# Altium schematic sheet IO.SchDoc
size B; SheetNumber: 4; SheetTotal: 4
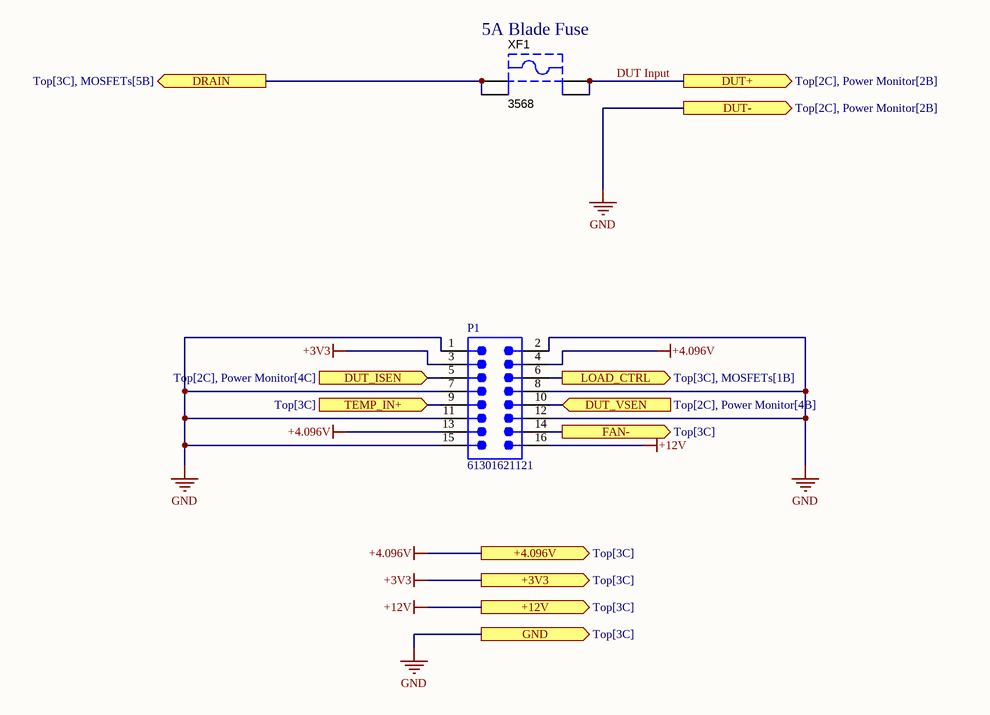
[diagram p0: IO.SchDoc]

## Parts
P1  61301621121  [61301621121]
XF1  3568  [KSTN-3568_V]

## Ports
+3V3 (out, see Top[3C]), +4.096V (out, see Top[3C]), +12V (out, see Top[3C]), DRAIN (out, see Top[3C], MOSFETs[5B]), DUT+ (out, see Top[2C], Power Monitor[2B]), DUT- (out, see Top[2C], Power Monitor[2B]), DUT_ISEN (in, see Top[2C], Power Monitor[4C]), DUT_VSEN (in, see Top[2C], Power Monitor[4B]), FAN- (out, see Top[3C]), GND (out, see Top[3C]), LOAD_CTRL (out, see Top[3C], MOSFETs[1B]), TEMP_IN+ (in, see Top[3C])

## Nets
+3V3: P1.3 ; port +3V3
+4.096V: P1.4 P1.13 ; port +4.096V
+12V: P1.16 ; port +12V
GND: P1.1 P1.2 P1.7 P1.8 P1.11 P1.12 P1.15 ; port DUT-, port GND
DRAIN: XF1.1 XF1.2 ; port DRAIN
DUT Input: XF1.3 XF1.4 ; port DUT+
DUT_ISEN: P1.5 ; port DUT_ISEN
DUT_VSEN: P1.10 ; port DUT_VSEN
FAN-: P1.14 ; port FAN-
LOAD_CTRL: P1.6 ; port LOAD_CTRL
TEMP_IN+: P1.9 ; port TEMP_IN+

## Notes on the sheet
- (near XF1) 5A Blade Fuse

## Library data of the parts
P1 = CMP-1502-01097-3: NexarPartId: 32855550; Contact Resistance: 20mΩ; Operating Supply Voltage: 250V; Number of Contacts: 16; Current Rating: 3A; Connector Type: Male Pin; Row Spacing: 2.54mm; Gender: Male; Min Operating Temperature: -40°C; Contact Material: Copper; RoHS: Compliant; Lead Pitch: 2.54mm; Color: Black; Contact Mating Length: 5.9944mm; REACH SVHC: Unknown; Number of Rows: 2; Orientation: Vertical; Number of Positions: 16; Max Operating Temperature: 105°C; Termination: Solder; Packaging: Bulk; Height: 8.89mm; Mount: Through Hole; Contact Plating: Gold; Voltage Rating: 250V; Number of Pins: 16; Pitch: 2.54mm
XF1 = CMP-2000-05464-1: JLCPCB: / C19727305 / Fuse Holder, 20 A, 500 V, -50 to 145 degC, 4-Pin THD, RoHS; Manufacturer: Keystone; Package Reference: 3568; Datasheet Version: 04/2013; Datasheet URL: https://datasheet.ciiva.com/16294/m60-2p40-16294706.pdf; Manufacturer URL: http://www.keyelco.com/; Mounting Technology: ThroughHole; Package Description: 4-Pin Through Hole Device, Body 16 x 6.73 mm, Pitch 9.9 mm